# Altium schematic sheet Servo_Signal_Ext.SchDoc
size A; DocumentNumber: 8; SheetNumber: 8; SheetTotal: 14
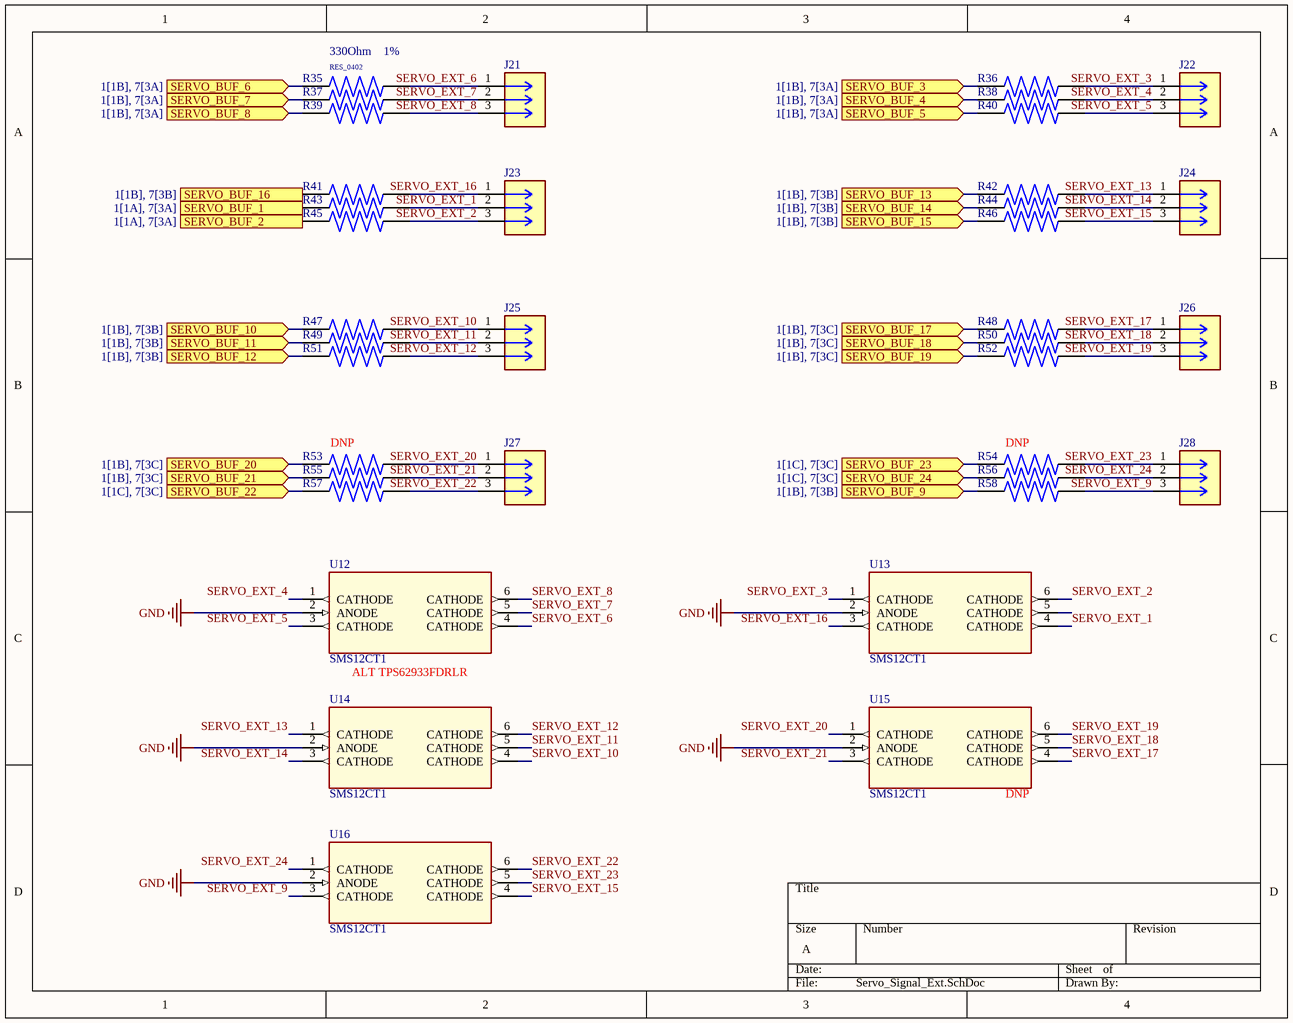
[diagram p0: Servo_Signal_Ext.SchDoc]

## Parts
J21  PIN_HEADER_1X3_2.54_VERTICAL  [PIN_HEADER_1X3_2.54_VERTICAL]  (value not drawn)
J22  PIN_HEADER_1X3_2.54_VERTICAL  [PIN_HEADER_1X3_2.54_VERTICAL]  (value not drawn)
J23  PIN_HEADER_1X3_2.54_VERTICAL  [PIN_HEADER_1X3_2.54_VERTICAL]  (value not drawn)
J24  PIN_HEADER_1X3_2.54_VERTICAL  [PIN_HEADER_1X3_2.54_VERTICAL]  (value not drawn)
J25  PIN_HEADER_1X3_2.54_VERTICAL  [PIN_HEADER_1X3_2.54_VERTICAL]  (value not drawn)
J26  PIN_HEADER_1X3_2.54_VERTICAL  [PIN_HEADER_1X3_2.54_VERTICAL]  (value not drawn)
J27  PIN_HEADER_1X3_2.54_VERTICAL  [PIN_HEADER_1X3_2.54_VERTICAL]  (value not drawn)
J28  PIN_HEADER_1X3_2.54_VERTICAL  [PIN_HEADER_1X3_2.54_VERTICAL]  (value not drawn)
R35  RES_0402  value 330Ohm  Tolerance: 1%  [RES_0402]
R36  RES_0402  [RES_0402]  (value not drawn)
R37  RES_0402  [RES_0402]  (value not drawn)
R38  RES_0402  [RES_0402]  (value not drawn)
R39  RES_0402  [RES_0402]  (value not drawn)
R40  RES_0402  [RES_0402]  (value not drawn)
R41  RES_0402  [RES_0402]  (value not drawn)
R42  RES_0402  [RES_0402]  (value not drawn)
R43  RES_0402  [RES_0402]  (value not drawn)
R44  RES_0402  [RES_0402]  (value not drawn)
R45  RES_0402  [RES_0402]  (value not drawn)
R46  RES_0402  [RES_0402]  (value not drawn)
R47  RES_0402  [RES_0402]  (value not drawn)
R48  RES_0402  [RES_0402]  (value not drawn)
R49  RES_0402  [RES_0402]  (value not drawn)
R50  RES_0402  [RES_0402]  (value not drawn)
R51  RES_0402  [RES_0402]  (value not drawn)
R52  RES_0402  [RES_0402]  (value not drawn)
R53  RES_0402  [RES_0402]  (value not drawn)
R54  RES_0402  [RES_0402]  (value not drawn)
R55  RES_0402  [RES_0402]  (value not drawn)
R56  RES_0402  [RES_0402]  (value not drawn)
R57  RES_0402  [RES_0402]  (value not drawn)
R58  RES_0402  [RES_0402]  (value not drawn)
U12  SMS12CT1  [SOT95P275X110-6N]
U13  SMS12CT1  [SOT95P275X110-6N]
U14  SMS12CT1  [SOT95P275X110-6N]
U15  SMS12CT1  [SOT95P275X110-6N]
U16  SMS12CT1  [SOT95P275X110-6N]

## Ports
SERVO_BUF_1 (in, see 1[1A], 7[3A]), SERVO_BUF_2 (in, see 1[1A], 7[3A]), SERVO_BUF_3 (in, see 1[1B], 7[3A]), SERVO_BUF_4 (in, see 1[1B], 7[3A]), SERVO_BUF_5 (in, see 1[1B], 7[3A]), SERVO_BUF_6 (in, see 1[1B], 7[3A]), SERVO_BUF_7 (in, see 1[1B], 7[3A]), SERVO_BUF_8 (in, see 1[1B], 7[3A]), SERVO_BUF_9 (in, see 1[1B], 7[3B]), SERVO_BUF_10 (in, see 1[1B], 7[3B]), SERVO_BUF_11 (in, see 1[1B], 7[3B]), SERVO_BUF_12 (in, see 1[1B], 7[3B]), SERVO_BUF_13 (in, see 1[1B], 7[3B]), SERVO_BUF_14 (in, see 1[1B], 7[3B]), SERVO_BUF_15 (in, see 1[1B], 7[3B]), SERVO_BUF_16 (in, see 1[1B], 7[3B]), SERVO_BUF_17 (in, see 1[1B], 7[3C]), SERVO_BUF_18 (in, see 1[1B], 7[3C]), SERVO_BUF_19 (in, see 1[1B], 7[3C]), SERVO_BUF_20 (in, see 1[1B], 7[3C]), SERVO_BUF_21 (in, see 1[1B], 7[3C]), SERVO_BUF_22 (in, see 1[1C], 7[3C]), SERVO_BUF_23 (in, see 1[1C], 7[3C]), SERVO_BUF_24 (in, see 1[1C], 7[3C])

## Nets
GND: U12.2(ANODE) U13.2(ANODE) U14.2(ANODE) U15.2(ANODE) U16.2(ANODE)
SERVO_BUF_1: R43.2 ; port SERVO_BUF_1
SERVO_BUF_2: R45.2 ; port SERVO_BUF_2
SERVO_BUF_3: R36.2 ; port SERVO_BUF_3
SERVO_BUF_4: R38.2 ; port SERVO_BUF_4
SERVO_BUF_5: R40.2 ; port SERVO_BUF_5
SERVO_BUF_6: R35.2 ; port SERVO_BUF_6
SERVO_BUF_7: R37.2 ; port SERVO_BUF_7
SERVO_BUF_8: R39.2 ; port SERVO_BUF_8
SERVO_BUF_9: R58.2 ; port SERVO_BUF_9
SERVO_BUF_10: R47.2 ; port SERVO_BUF_10
SERVO_BUF_11: R49.2 ; port SERVO_BUF_11
SERVO_BUF_12: R51.2 ; port SERVO_BUF_12
SERVO_BUF_13: R42.2 ; port SERVO_BUF_13
SERVO_BUF_14: R44.2 ; port SERVO_BUF_14
SERVO_BUF_15: R46.2 ; port SERVO_BUF_15
SERVO_BUF_16: R41.2 ; port SERVO_BUF_16
SERVO_BUF_17: R48.2 ; port SERVO_BUF_17
SERVO_BUF_18: R50.2 ; port SERVO_BUF_18
SERVO_BUF_19: R52.2 ; port SERVO_BUF_19
SERVO_BUF_20: R53.2 ; port SERVO_BUF_20
SERVO_BUF_21: R55.2 ; port SERVO_BUF_21
SERVO_BUF_22: R57.2 ; port SERVO_BUF_22
SERVO_BUF_23: R54.2 ; port SERVO_BUF_23
SERVO_BUF_24: R56.2 ; port SERVO_BUF_24
SERVO_EXT_1: J23.2 R43.1 U13.4(CATHODE)
SERVO_EXT_2: J23.3 R45.1 U13.6(CATHODE)
SERVO_EXT_3: J22.1 R36.1 U13.1(CATHODE)
SERVO_EXT_4: J22.2 R38.1 U12.1(CATHODE)
SERVO_EXT_5: J22.3 R40.1 U12.3(CATHODE)
SERVO_EXT_6: J21.1 R35.1 U12.4(CATHODE)
SERVO_EXT_7: J21.2 R37.1 U12.5(CATHODE)
SERVO_EXT_8: J21.3 R39.1 U12.6(CATHODE)
SERVO_EXT_9: J28.3 R58.1 U16.3(CATHODE)
SERVO_EXT_10: J25.1 R47.1 U14.4(CATHODE)
SERVO_EXT_11: J25.2 R49.1 U14.5(CATHODE)
SERVO_EXT_12: J25.3 R51.1 U14.6(CATHODE)
SERVO_EXT_13: J24.1 R42.1 U14.1(CATHODE)
SERVO_EXT_14: J24.2 R44.1 U14.3(CATHODE)
SERVO_EXT_15: J24.3 R46.1 U16.4(CATHODE)
SERVO_EXT_16: J23.1 R41.1 U13.3(CATHODE)
SERVO_EXT_17: J26.1 R48.1 U15.4(CATHODE)
SERVO_EXT_18: J26.2 R50.1 U15.5(CATHODE)
SERVO_EXT_19: J26.3 R52.1 U15.6(CATHODE)
SERVO_EXT_20: J27.1 R53.1 U15.1(CATHODE)
SERVO_EXT_21: J27.2 R55.1 U15.3(CATHODE)
SERVO_EXT_22: J27.3 R57.1 U16.6(CATHODE)
SERVO_EXT_23: J28.1 R54.1 U16.5(CATHODE)
SERVO_EXT_24: J28.2 R56.1 U16.1(CATHODE)

Not connected (* = marked no-connect by the designer): U13 5(CATHODE)

## Notes on the sheet
- (near R53) DNP
- (near R54) DNP
- ALT TPS62933FDRLR
- (near U15) DNP

## Library data of the parts
J21-J28 = PIN_HEADER_3P: GENERIC PIN HEADER 3P; MPN: 10129378-903001BLF; MF: Amphenol; LCSC Part Number: C5470076
R35 = RES: GENERIC RES; MPN: RC0402FR-07330RL; Power Rating: *; Rated Voltage: *; Temperature Coefficient: *; LCSC Part Number: C105875
R36-R58 = RES: GENERIC RES; MPN: RC0402FR-07330RL; Tolerance: 1%; Value: 330Ohm; Power Rating: *; Rated Voltage: *; Temperature Coefficient: *; LCSC Part Number: C105875
U12-U16 = SMS12CT1: 23V Clamp 15A (8/20µs) Ipp Tvs Diode Surface Mount SC-74; MP: onsemi; MPN: SMS12CT1